# EAGLE design ExpansionModule (EAGLE 9.6.2)
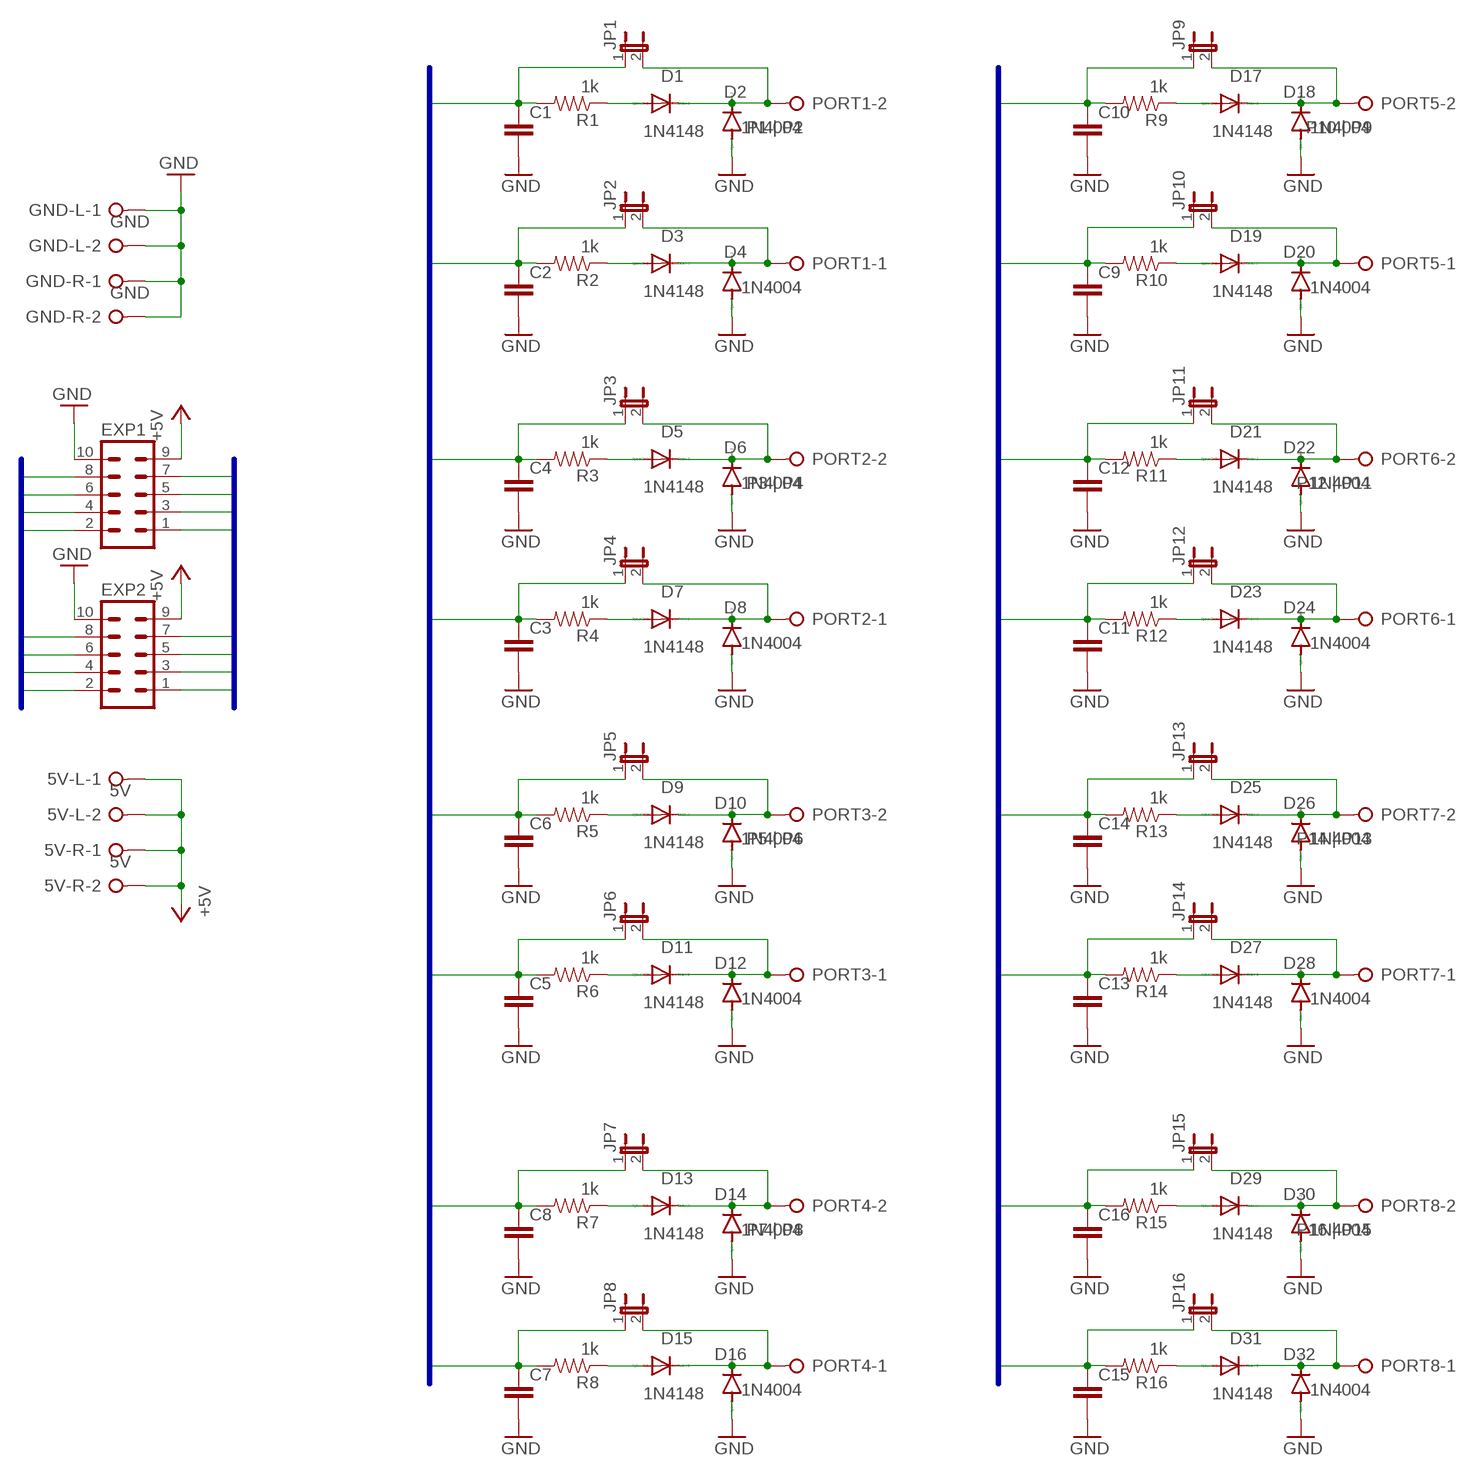
[diagram p0: schematic, sheet 1]

## Parts
5V-L  5V  W237-02P  [W237-132]
5V-R  5V  W237-02P  [W237-132]
C1  C-EU050-030X075  [C050-030X075]
C2  C-EU050-030X075  [C050-030X075]
C3  C-EU050-030X075  [C050-030X075]
C4  C-EU050-030X075  [C050-030X075]
C5  C-EU050-030X075  [C050-030X075]
C6  C-EU050-030X075  [C050-030X075]
C7  C-EU050-030X075  [C050-030X075]
C8  C-EU050-030X075  [C050-030X075]
C9  C-EU050-030X075  [C050-030X075]
C10  C-EU050-030X075  [C050-030X075]
C11  C-EU050-030X075  [C050-030X075]
C12  C-EU050-030X075  [C050-030X075]
C13  C-EU050-030X075  [C050-030X075]
C14  C-EU050-030X075  [C050-030X075]
C15  C-EU050-030X075  [C050-030X075]
C16  C-EU050-030X075  [C050-030X075]
D1  1N4148  1N4148DO35-7  [DO35-7]
D2  1N4004  [DO41-10]
D3  1N4148  1N4148DO35-7  [DO35-7]
D4  1N4004  [DO41-10]
D5  1N4148  1N4148DO35-7  [DO35-7]
D6  1N4004  [DO41-10]
D7  1N4148  1N4148DO35-7  [DO35-7]
D8  1N4004  [DO41-10]
D9  1N4148  1N4148DO35-7  [DO35-7]
D10  1N4004  [DO41-10]
D11  1N4148  1N4148DO35-7  [DO35-7]
D12  1N4004  [DO41-10]
D13  1N4148  1N4148DO35-7  [DO35-7]
D14  1N4004  [DO41-10]
D15  1N4148  1N4148DO35-7  [DO35-7]
D16  1N4004  [DO41-10]
D17  1N4148  1N4148DO35-7  [DO35-7]
D18  1N4004  [DO41-10]
D19  1N4148  1N4148DO35-7  [DO35-7]
D20  1N4004  [DO41-10]
D21  1N4148  1N4148DO35-7  [DO35-7]
D22  1N4004  [DO41-10]
D23  1N4148  1N4148DO35-7  [DO35-7]
D24  1N4004  [DO41-10]
D25  1N4148  1N4148DO35-7  [DO35-7]
D26  1N4004  [DO41-10]
D27  1N4148  1N4148DO35-7  [DO35-7]
D28  1N4004  [DO41-10]
D29  1N4148  1N4148DO35-7  [DO35-7]
D30  1N4004  [DO41-10]
D31  1N4148  1N4148DO35-7  [DO35-7]
D32  1N4004  [DO41-10]
EXP1  ML10  [ML10]
EXP2  ML10  [ML10]
GND-L  GND  W237-02P  [W237-132]
GND-R  GND  W237-02P  [W237-132]
JP1  JP1E  [JP1]
JP2  JP1E  [JP1]
JP3  JP1E  [JP1]
JP4  JP1E  [JP1]
JP5  JP1E  [JP1]
JP6  JP1E  [JP1]
JP7  JP1E  [JP1]
JP8  JP1E  [JP1]
JP9  JP1E  [JP1]
JP10  JP1E  [JP1]
JP11  JP1E  [JP1]
JP12  JP1E  [JP1]
JP13  JP1E  [JP1]
JP14  JP1E  [JP1]
JP15  JP1E  [JP1]
JP16  JP1E  [JP1]
PORT1  P1 | P2  W237-02P  [W237-132]
PORT2  P3 | P4  W237-02P  [W237-132]
PORT3  P5 | P6  W237-02P  [W237-132]
PORT4  P7 | P8  W237-02P  [W237-132]
PORT5  P10 | P9  W237-02P  [W237-132]
PORT6  P12 | P11  W237-02P  [W237-132]
PORT7  P14 | P13  W237-02P  [W237-132]
PORT8  P16 | P15  W237-02P  [W237-132]
R1  1k  RESISTORAXIAL-0.3  [AXIAL-0.3]
R2  1k  RESISTORAXIAL-0.3  [AXIAL-0.3]
R3  1k  RESISTORAXIAL-0.3  [AXIAL-0.3]
R4  1k  RESISTORAXIAL-0.3  [AXIAL-0.3]
R5  1k  RESISTORAXIAL-0.3  [AXIAL-0.3]
R6  1k  RESISTORAXIAL-0.3  [AXIAL-0.3]
R7  1k  RESISTORAXIAL-0.3  [AXIAL-0.3]
R8  1k  RESISTORAXIAL-0.3  [AXIAL-0.3]
R9  1k  RESISTORAXIAL-0.3  [AXIAL-0.3]
R10  1k  RESISTORAXIAL-0.3  [AXIAL-0.3]
R11  1k  RESISTORAXIAL-0.3  [AXIAL-0.3]
R12  1k  RESISTORAXIAL-0.3  [AXIAL-0.3]
R13  1k  RESISTORAXIAL-0.3  [AXIAL-0.3]
R14  1k  RESISTORAXIAL-0.3  [AXIAL-0.3]
R15  1k  RESISTORAXIAL-0.3  [AXIAL-0.3]
R16  1k  RESISTORAXIAL-0.3  [AXIAL-0.3]

## Nets
+5V: 5V-L.1 5V-L.2 5V-R.1 5V-R.2 EXP1.9 EXP2.9
A0: C12.1 EXP2.3 JP11.1 R11.P$2
A1: C11.1 EXP2.4 JP12.1 R12.P$2
A2: C14.1 EXP2.5 JP13.1 R13.P$2
A3: C13.1 EXP2.6 JP14.1 R14.P$2
GND [ground]: C1.2 C2.2 C3.2 C4.2 C5.2 C6.2 C7.2 C8.2 C9.2 C10.2 C11.2 C12.2 C13.2 C14.2 C15.2 C16.2 D2.A D4.A D6.A D8.A D10.A D12.A D14.A D16.A D18.A D20.A D22.A D24.A D26.A D28.A D30.A D32.A EXP1.10 EXP2.10 GND-L.1 GND-L.2 GND-R.1 GND-R.2
N$2: D1.A R1.P$1
N$3: D3.A R2.P$1
N$6: D5.A R3.P$1
N$7: D7.A R4.P$1
N$10: D9.A R5.P$1
N$11: D11.A R6.P$1
N$14: D13.A R7.P$1
N$15: D15.A R8.P$1
N$18: D17.A R9.P$1
N$19: D19.A R10.P$1
N$22: D21.A R11.P$1
N$23: D23.A R12.P$1
N$26: D25.A R13.P$1
N$27: D27.A R14.P$1
N$30: D29.A R15.P$1
N$31: D31.A R16.P$1
PIN2: C1.1 EXP1.1 JP1.1 R1.P$2
PIN3: C2.1 EXP1.2 JP2.1 R2.P$2
PIN4: C4.1 EXP1.3 JP3.1 R3.P$2
PIN5: C3.1 EXP1.4 JP4.1 R4.P$2
PIN6: C6.1 EXP1.5 JP5.1 R5.P$2
PIN9: C5.1 EXP1.6 JP6.1 R6.P$2
PIN10: C8.1 EXP1.7 JP7.1 R7.P$2
PIN11: C7.1 EXP1.8 JP8.1 R8.P$2
PIN12: C10.1 EXP2.1 JP9.1 R9.P$2
PIN13: C9.1 EXP2.2 JP10.1 R10.P$2
PORT1: D1.C D2.C JP1.2 PORT1.2
PORT2: D3.C D4.C JP2.2 PORT1.1
PORT3: D5.C D6.C JP3.2 PORT2.2
PORT4: D7.C D8.C JP4.2 PORT2.1
PORT5: D9.C D10.C JP5.2 PORT3.2
PORT6: D11.C D12.C JP6.2 PORT3.1
PORT7: D13.C D14.C JP7.2 PORT4.2
PORT8: D15.C D16.C JP8.2 PORT4.1
PORT9: D17.C D18.C JP9.2 PORT5.2
PORT10: D19.C D20.C JP10.2 PORT5.1
PORT11: D21.C D22.C JP11.2 PORT6.2
PORT12: D23.C D24.C JP12.2 PORT6.1
PORT13: D25.C D26.C JP13.2 PORT7.2
PORT14: D27.C D28.C JP14.2 PORT7.1
PORT15: D29.C D30.C JP15.2 PORT8.2
PORT16: D31.C D32.C JP16.2 PORT8.1
SCL: C15.1 EXP2.8 JP16.1 R16.P$2
SDA: C16.1 EXP2.7 JP15.1 R15.P$2

## Buses
EXPANSION:A0,A1,A2,A3,PIN2,PIN3,PIN4,PIN5,PIN6,PIN9,PIN10,PIN11,PIN12,PIN13,SCL,SDA

## Library data of the parts
5V-L 5V-R GND-L GND-R PORT1-PORT8 = con-wago-508:W237-02P: WAGO SREW CLAMP; OC_FARNELL: unknown; OC_NEWARK: unknown
C1-C16 = rcl:C-EU: CAPACITOR, European symbol; SPICEPREFIX: C
D1 D3 D5 D7 D9 D11 D13 D15 D17 D19 D21 D23 D25 D27 D29 D31 = diode:1N4148: DIODE high speed (Philips)
D2 D4 D6 D8 D10 D12 D14 D16 D18 D20 D22 D24 D26 D28 D30 D32 = diode:1N4004: DIODE general purpose rectifier, 1 A
EXP1 EXP2 = con-ml:ML10: HARTING; OC_FARNELL: unknown; OC_NEWARK: unknown
JP1-JP16 = jumper:JP1E: JUMPER
R1-R16 = SparkFun-Resistors:RESISTOR: Resistor Basic schematic elements and footprints for 0603, 1206, and PTH resistors.

## Net classes
0 default: width 0.254 mm
1 ground: width 0.61 mm
2 5v: width 0.508 mm

## Board
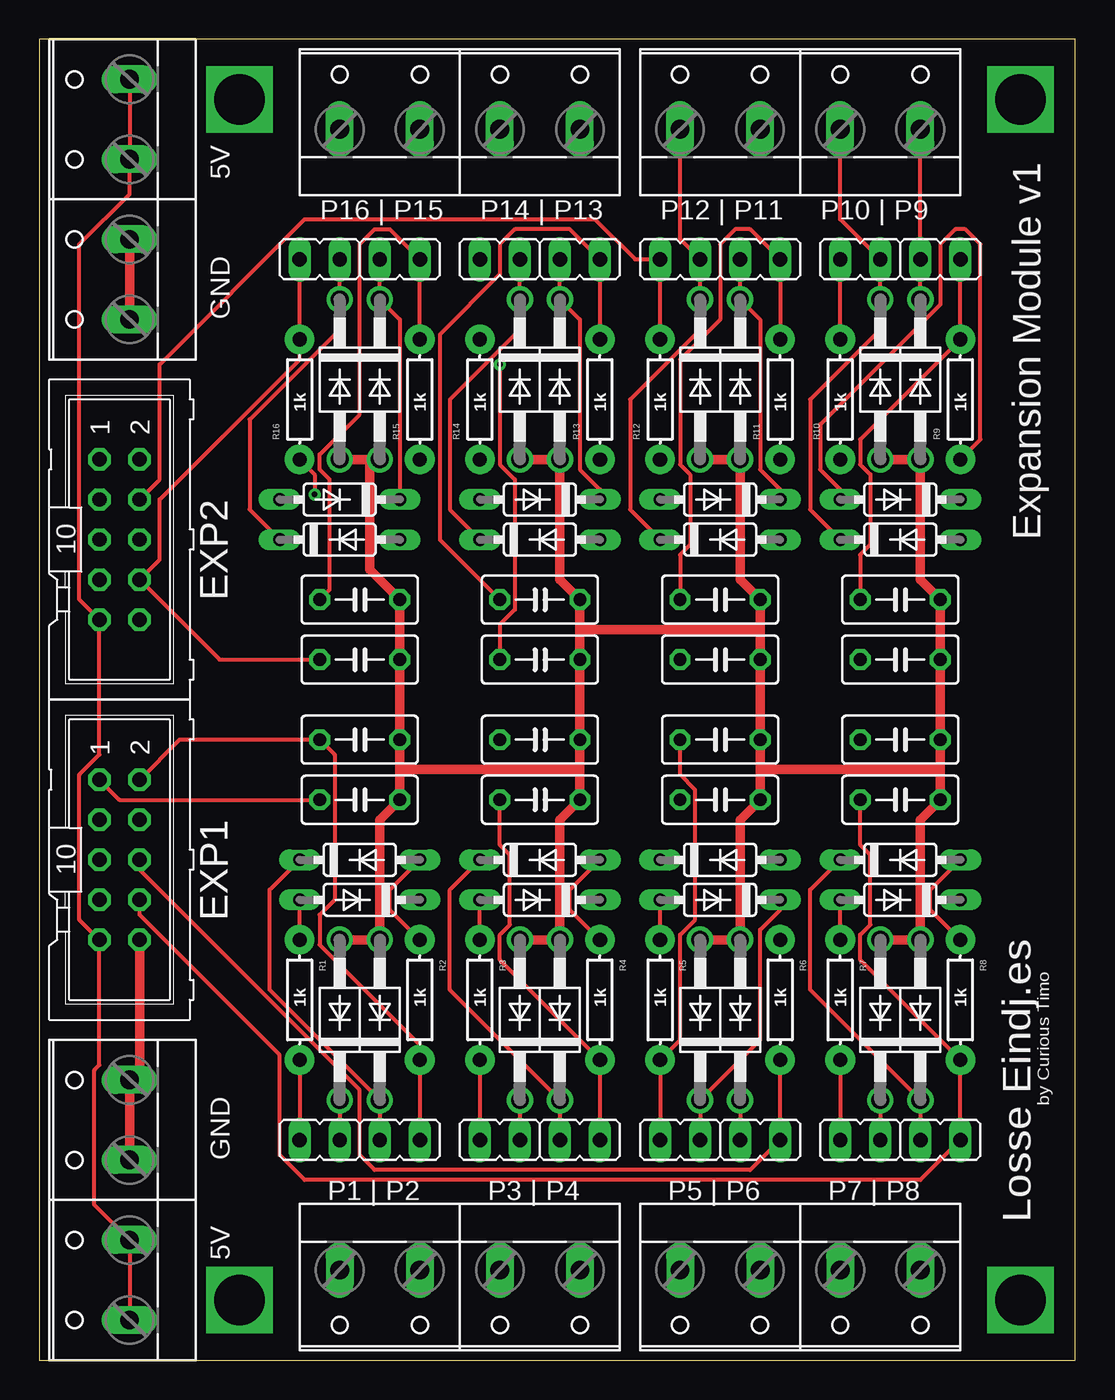
[diagram p1: board, top side]
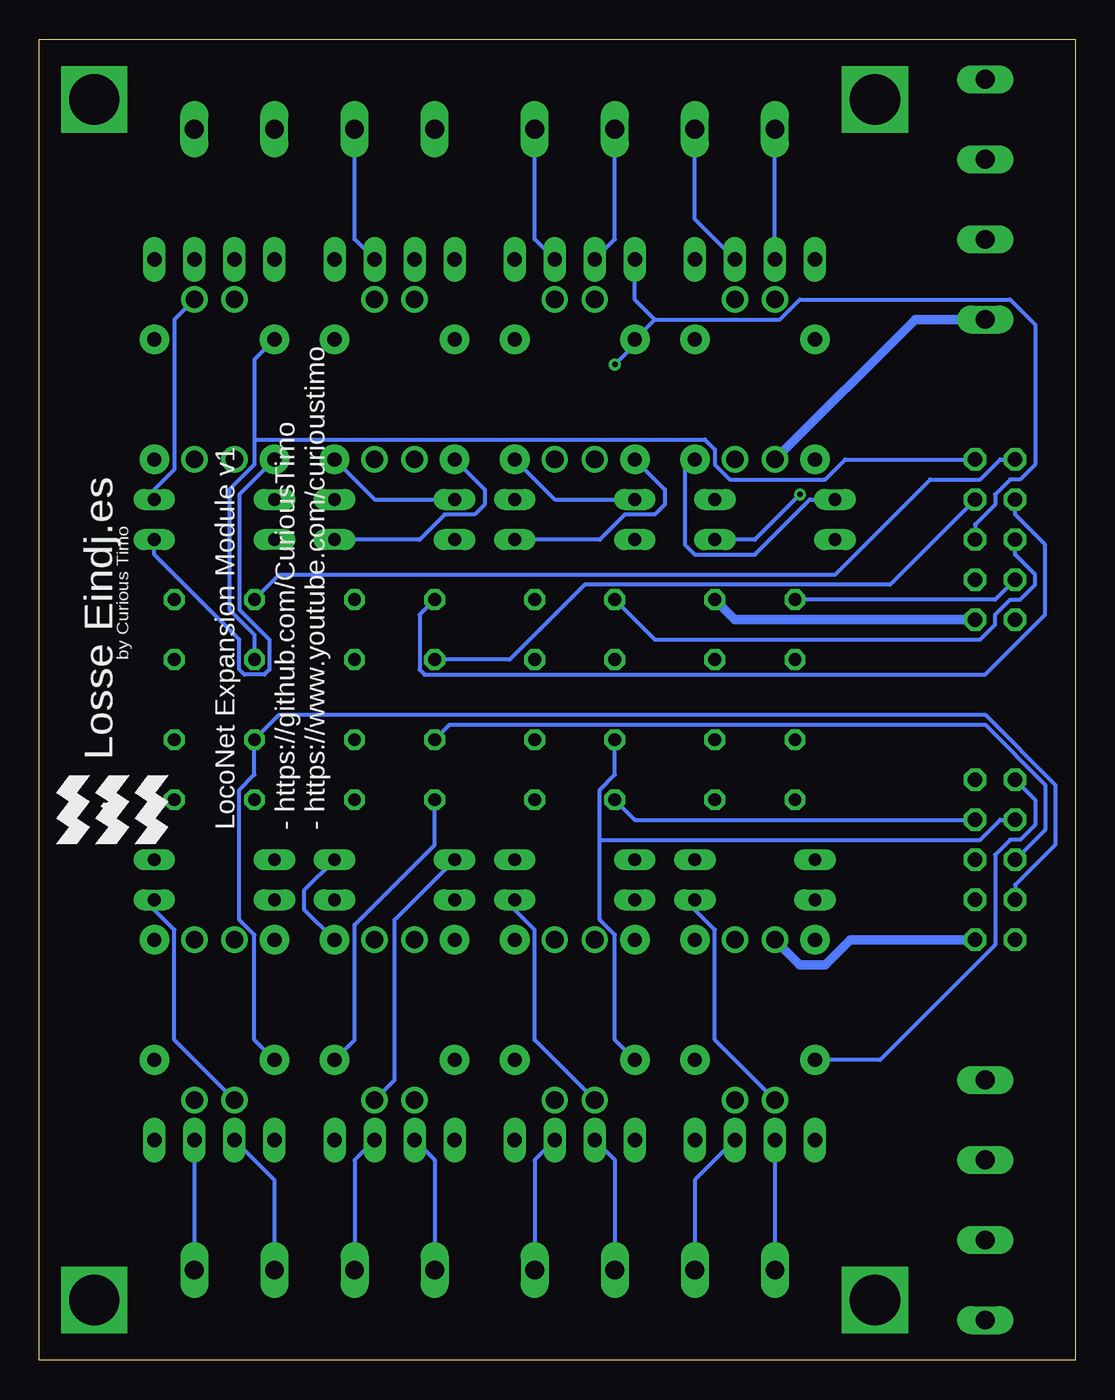
[diagram p2: board, bottom side, seen from below]

Size 65.71 x 83.81 mm. Coordinates in mm from the lower left corner, seen from the top.
Outline: 0,0 65.71,0 65.71,83.81 0,83.81 0,0
Copper layers (1*16): Top 0.035mm / dielectric 1.5mm / Bottom 0.035mm
Design rules "default": minimum track width 6mil, minimum drill 0.35mm, track to track 6mil, track to pad 6mil, pad to pad 6mil, via to via 6mil, smd to smd 6mil, copper to edge 40mil, drill to drill 6mil, minimum pad ring 10mil, minimum via ring 8mil, stop-mask expansion 4mil, vias tented up to drill 0mil, thermal gap 10mil

### Footprints (pad centres in the part's own frame; a part is rotated, then mirrored left to right if it is on the bottom)
W237-132 = drill 1.194 long: 1 -2.54,-0.635; 2 2.54,-0.635
C050-030X075 = drill 0.813 octagon: 1 -2.54,0; 2 2.54,0
DO35-7 = drill 0.813 long: A 3.81,0; C -3.81,0
DO41-10 = drill 1.118: A 5.08,0; C -5.08,0
ML10 = drill 0.914 octagon: 1 -5.08,-1.27; 2 -5.08,1.27; 3 -2.54,-1.27; 4 -2.54,1.27; 5 0,-1.27; 6 0,1.27; 7 2.54,-1.27; 8 2.54,1.27; 9 5.08,-1.27; 10 5.08,1.27
JP1 = drill 0.914 long: 1 0,-1.27; 2 0,1.27
AXIAL-0.3 = drill 0.9 pad 1.88: P$1 -3.81,0; P$2 3.81,0

### Placement (x,y rotation side)
5V-L  5.08,78.74 90 top
5V-R  5.08,5.08 90 top
C1  20.32,35.56 0 top
C2  20.32,39.37 0 top
C3  31.75,35.56 0 top
C4  31.75,39.37 0 top
C5  43.18,35.56 0 top
C6  43.18,39.37 0 top
C7  54.61,35.56 0 top
C8  54.61,39.37 0 top
C9  54.61,44.45 0 top
C10  54.61,48.26 0 top
C11  43.18,44.45 0 top
C12  43.18,48.26 0 top
C13  31.75,44.45 0 top
C14  31.75,48.26 0 top
C15  20.32,44.45 0 top
C16  20.32,48.26 0 top
D1  20.32,29.21 180 top
D2  19.05,21.59 90 top
D3  20.32,31.75 0 top
D4  21.59,21.59 90 top
D5  31.75,29.21 180 top
D6  30.48,21.59 90 top
D7  31.75,31.75 0 top
D8  33.02,21.59 90 top
D9  43.18,29.21 180 top
D10  41.91,21.59 90 top
D11  43.18,31.75 0 top
D12  44.45,21.59 90 top
D13  54.61,29.21 180 top
D14  53.34,21.59 90 top
D15  54.61,31.75 0 top
D16  55.88,21.59 90 top
D17  54.61,54.61 180 top
D18  55.88,62.23 270 top
D19  54.61,52.07 0 top
D20  53.34,62.23 270 top
D21  43.18,54.61 180 top
D22  44.45,62.23 270 top
D23  43.18,52.07 0 top
D24  41.91,62.23 270 top
D25  31.75,54.61 180 top
D26  33.02,62.23 270 top
D27  31.75,52.07 0 top
D28  30.48,62.23 270 top
D29  19.05,54.61 180 top
D30  21.59,62.23 270 top
D31  19.05,52.07 0 top
D32  19.05,62.23 270 top
EXP1  5.08,31.75 270 top
EXP2  5.08,52.07 270 top
GND-L  5.08,68.58 90 top
GND-R  5.08,15.24 90 top
JP1  17.78,13.97 270 top
JP2  22.86,13.97 90 top
JP3  29.21,13.97 270 top
JP4  34.29,13.97 90 top
JP5  40.64,13.97 270 top
JP6  45.72,13.97 90 top
JP7  52.07,13.97 270 top
JP8  57.15,13.97 90 top
JP9  57.15,69.85 90 top
JP10  52.07,69.85 270 top
JP11  45.72,69.85 90 top
JP12  40.64,69.85 270 top
JP13  34.29,69.85 90 top
JP14  29.21,69.85 270 top
JP15  22.86,69.85 90 top
JP16  17.78,69.85 270 top
PORT1  21.59,5.08 180 top
PORT2  31.75,5.08 180 top
PORT3  43.18,5.08 180 top
PORT4  53.34,5.08 180 top
PORT5  53.34,78.74 0 top
PORT6  43.18,78.74 0 top
PORT7  31.75,78.74 0 top
PORT8  21.59,78.74 0 top
R1  16.51,22.86 270 top
R2  24.13,22.86 270 top
R3  27.94,22.86 270 top
R4  35.56,22.86 270 top
R5  39.37,22.86 270 top
R6  46.99,22.86 270 top
R7  50.8,22.86 270 top
R8  58.42,22.86 270 top
R9  58.42,60.96 90 top
R10  50.8,60.96 90 top
R11  46.99,60.96 90 top
R12  39.37,60.96 90 top
R13  35.56,60.96 90 top
R14  27.94,60.96 90 top
R15  24.13,60.96 90 top
R16  16.51,60.96 90 top

### Tracks (layer width: path | path; a pad name or v marks a point on that pad's centre or on a via)
+5V
  Top 0.254: 5V-L.2 5V-L.1 5.71,73.98 2.54,70.8 2.54,48.26 EXP2.9 3.81,38.42 2.54,37.15 2.54,27.94 EXP1.9 3.81,18.73 3.49,18.41 3.49,9.84 5V-R.2 5V-R.1
A0
  Top 0.254: C12.1 40.64,51.12 41.28,51.75 41.28,56.2 40.64,56.83 40.64,63.5 43.18,66.04 43.18,70.8 44.13,71.76 45.09,71.76 JP11.1 R11.P$2
  Bottom 0.254: EXP2.3 3.81,53.66 1.91,51.75 1.91,47.31 5.71,43.5 41.28,43.5 41.59,43.81 41.59,47.31 C12.1
A1
  Top 0.254: R12.P$2 JP12.1 37.78,69.85 35.24,72.39 16.83,72.39 7.62,63.18 7.62,55.88 EXP2.4
  Bottom 0.254: C11.1 35.88,44.45 31.11,49.21 11.75,49.21 EXP2.4
A2
  Top 0.254: C14.1 25.4,52.07 25.4,65.09 29.21,68.9 29.21,70.8 30.16,71.76 33.66,71.76 JP13.1 R13.P$2
  Bottom 0.254: EXP2.5 3.81,51.12 2.54,49.85 2.54,49.21 3.49,48.26 4.13,48.26 5.08,47.31 5.08,46.67 6.03,45.72 26.67,45.72 C14.1
A3  (via drill 0.35)
  Top 0.254: C13.1 29.21,46.67 30.16,47.62 30.16,55.88 29.21,56.83 v29.21,63.18
  Bottom 0.254: v29.21,63.18 27.94,64.45 R14.P$2 26.67,66.04 | EXP2.6 6.35,53.02 5.08,54.29 5.08,54.93 4.13,55.88 3.49,55.88 2.54,56.83 2.54,65.72 4.13,67.31 17.46,67.31 18.73,66.04 26.67,66.04 | JP14.1 27.94,67.31 26.67,66.04
GND
  Top 0.61: D24.A D22.A 44.45,49.53 C12.2 45.72,46.35 | D10.A D12.A 44.45,34.29 C5.2 45.72,37.46 | 45.72,37.46 C6.2 C11.2 45.72,46.35 | D20.A D18.A 55.88,49.53 C10.2 C9.2 C8.2 57.15,37.46 | D14.A D16.A 55.88,34.29 C7.2 57.15,37.46 | 57.15,37.46 45.72,37.46 | D28.A D26.A 33.02,49.53 C14.2 34.29,46.35 | D6.A D8.A 33.02,34.29 C3.2 34.29,37.46 | 34.29,37.46 C4.2 C13.2 34.29,46.35 | EXP1.10 6.35,18.41 GND-R.2 GND-R.1 | GND-L.2 GND-L.1 | 20.95,57.15 D32.A | D2.A D4.A 21.59,34.29 C1.2 22.86,37.46 | 22.86,37.46 C2.2 C15.2 C16.2 20.95,50.16 20.95,57.15 | 20.95,57.15 D30.A | 22.86,37.46 34.29,37.46 | 34.29,46.35 45.72,46.35
  Bottom 0.61: EXP2.10 21.59,46.99 C16.2 | GND-L.1 10.16,66.04 D32.A | EXP1.10 14.29,26.67 15.88,25.08 17.46,25.08 D2.A
N$2
  Top 0.254: R1.P$1 D1.A
N$3
  Top 0.254: D3.A 22.22,29.84 22.22,28.57 R2.P$1
N$6
  Top 0.254: R3.P$1 D5.A
N$7
  Top 0.254: D7.A 33.66,29.84 33.66,28.57 R4.P$1
N$10
  Top 0.254: R5.P$1 D9.A
N$11
  Bottom 0.254: D11.A 48.9,29.84 48.9,28.57 R6.P$1
N$14
  Top 0.254: R7.P$1 D13.A
N$15
  Top 0.254: D15.A 56.52,29.84 56.52,28.57 R8.P$1
N$18
  Top 0.254: D17.A 50.8,55.24 49.53,56.52 49.53,59.37 57.15,66.99 57.15,70.8 58.1,71.76 58.74,71.76 59.69,70.8 59.69,58.42 R9.P$1
N$19
  Bottom 0.254: D19.A 58.42,51.12 53.02,45.72 53.02,43.81 52.71,43.5 51.44,43.5 51.12,43.81 51.12,45.72 53.02,47.62 53.02,54.93 R10.P$1
N$22
  Bottom 0.254: D21.A 44.45,54.61 R11.P$1
N$23
  Bottom 0.254: D23.A 41.59,52.07 40.01,53.66 38.1,53.66 37.47,54.29 37.47,55.24 R12.P$1
N$26
  Bottom 0.254: D25.A 33.02,54.61 R13.P$1
N$27
  Bottom 0.254: D27.A 30.16,52.07 28.57,53.66 26.67,53.66 26.04,54.29 26.04,55.24 R14.P$1
N$30
  Bottom 0.254: D29.A 16.83,54.61 20.32,51.12 24.13,51.12 24.76,51.75 24.76,56.52 R15.P$1
N$31  (via drill 0.35)
  Top 0.254: v17.46,54.93 17.46,56.2 R16.P$1
  Bottom 0.254: D31.A 20.32,52.07 v17.46,54.93
N$33  (via drill 3.2 pad 3.81)
  other vias: 12.7,80.01
N$34  (via drill 3.2 pad 3.81)
  other vias: 12.7,3.81
N$35  (via drill 3.2 pad 3.81)
  other vias: 62.23,80.01
N$36  (via drill 3.2 pad 3.81)
  other vias: 62.23,3.81
PIN2
  Top 0.254: R1.P$2 JP1.1 | C1.1 5.08,35.56 EXP1.1
  Bottom 0.254: R1.P$2 12.38,19.05 5.08,26.35 5.08,32.07 4.13,33.02 3.49,33.02 2.54,33.97 2.54,35.56 EXP1.1
PIN3
  Top 0.254: JP2.1 R2.P$2 24.13,20 17.78,26.35 17.78,28.26 18.73,29.21 18.73,38.42 C2.1 8.89,39.37 EXP1.2
PIN4
  Top 0.254: R3.P$2 JP3.1
  Bottom 0.254: C4.1 29.21,37.15 30.16,36.2 30.16,33.02 | 30.16,33.02 30.16,27.94 29.21,26.99 29.21,20.32 R3.P$2 | EXP1.3 4.76,34.29 6.03,33.02 30.16,33.02
PIN5
  Top 0.254: C3.1 29.21,32.7 29.84,32.07 29.84,27.62 29.21,26.99 29.21,25.4 R4.P$2 JP4.1
  Bottom 0.254: EXP1.4 27.94,34.29 C3.1
PIN6
  Top 0.254: C6.1 40.64,37.15 41.59,36.2 41.59,27.94 40.64,26.99 40.64,20.32 R5.P$2 JP5.1
  Bottom 0.254: EXP1.5 1.91,33.66 1.91,36.51 5.71,40.32 39.69,40.32 C6.1
PIN9
  Top 0.254: EXP1.6 6.35,31.11 20.32,17.14 20.32,13.02 21.27,12.07 45.09,12.07 JP6.1 R6.P$2
  Bottom 0.254: C5.1 40.64,32.7 45.72,27.62 45.72,20.32 R6.P$2
PIN10
  Top 0.254: R7.P$2 JP7.1
  Bottom 0.254: R7.P$2 52.07,20.32 52.07,26.99 53.02,27.94 53.02,36.2 52.07,37.15 C8.1 50.48,40.96 5.71,40.96 1.27,36.51 1.27,32.7 3.81,30.16 EXP1.7
PIN11
  Top 0.254: C7.1 52.07,32.7 52.71,32.07 52.71,27.62 52.07,26.99 52.07,25.4 R8.P$2 JP8.1 55.88,11.43 16.83,11.43 15.24,13.02 15.24,19.37 6.35,28.26 EXP1.8
PIN12
  Top 0.254: C10.1 52.07,51.12 52.71,51.75 52.71,56.2 52.07,56.83 52.07,58.42 R9.P$2 JP9.1
  Bottom 0.254: EXP2.1 4.76,57.15 6.03,55.88 9.21,55.88 15.24,49.85 50.48,49.85 C10.1
PIN13
  Top 0.254: R10.P$2 JP10.1
  Bottom 0.254: C9.1 52.07,46.04 53.66,47.62 53.66,55.24 52.07,56.83 52.07,58.42 | 52.07,58.42 52.07,63.5 R10.P$2 | EXP2.2 14.61,57.15 15.88,55.88 21.91,55.88 22.86,56.83 22.86,57.78 23.49,58.42 52.07,58.42
PORT1
  Top 0.254: D2.C JP1.2
  Bottom 0.254: D1.C 24.13,28.57 22.86,27.3 22.86,20.32 D2.C | JP1.2 PORT1.2
PORT2
  Top 0.254: D3.C 14.61,29.84 14.61,23.49 D4.C JP2.2
  Bottom 0.254: PORT1.1 24.13,11.43 JP2.2
PORT3
  Top 0.254: D6.C JP3.2
  Bottom 0.254: D5.C 35.56,28.57 34.29,27.3 34.29,20.32 D6.C | PORT2.2 29.21,12.7 JP3.2
PORT4
  Top 0.254: D7.C 26.04,29.84 26.04,23.49 D8.C JP4.2
  Bottom 0.254: PORT2.1 34.29,12.7 JP4.2
PORT5
  Top 0.254: D9.C 46.99,28.57 45.72,27.3 45.72,20.32 D10.C JP5.2
  Bottom 0.254: PORT3.2 40.64,12.7 JP5.2
PORT6
  Top 0.254: D12.C JP6.2
  Bottom 0.254: D11.C 43.18,27.94 43.18,17.78 D12.C | PORT3.1 45.72,12.7 JP6.2
PORT7
  Top 0.254: D14.C JP7.2
  Bottom 0.254: D13.C 58.42,28.57 57.15,27.3 57.15,20.32 D14.C | PORT4.2 50.8,11.43 JP7.2
PORT8
  Top 0.254: D15.C 48.9,29.84 48.9,23.49 D16.C JP8.2
  Bottom 0.254: JP8.2 PORT4.1
PORT9
  Top 0.254: D18.C JP9.2 PORT5.2
  Bottom 0.254: D17.C 58.42,55.24 57.15,56.52 57.15,66.04 D18.C
PORT10
  Top 0.254: D19.C 48.9,53.98 48.9,60.96 53.34,65.41 D20.C JP10.2 50.8,72.39 PORT5.1
PORT11
  Top 0.254: D21.C 46.99,55.24 45.72,56.52 45.72,66.04 D22.C JP11.2
  Bottom 0.254: PORT6.2 45.72,71.12 JP11.2
PORT12
  Top 0.254: D23.C 37.47,53.98 37.47,60.96 41.91,65.41 D24.C JP12.2 40.64,71.12 PORT6.1
PORT13
  Top 0.254: D25.C 35.56,55.24 34.29,56.52 34.29,66.04 D26.C JP13.2
  Bottom 0.254: PORT7.2 34.29,71.12 JP13.2
PORT14
  Top 0.254: D27.C 26.04,53.98 26.04,60.96 30.48,65.41 D28.C JP14.2
  Bottom 0.254: PORT7.1 29.21,71.12 JP14.2
PORT15
  Top 0.254: D29.C 22.86,66.04 D30.C JP15.2
  Bottom 0.254: PORT8.2 24.13,72.39 JP15.2
PORT16
  Top 0.254: D31.C 13.34,53.98 13.34,59.69 19.05,65.41 D32.C JP16.2
  Bottom 0.254: JP16.2 PORT8.1
SCL
  Top 0.254: JP16.1 R16.P$2 16.51,63.5 7.62,54.61 7.62,50.8 EXP2.8 11.43,44.45 C15.1
SDA
  Top 0.254: R15.P$2 JP15.1 22.22,71.76 21.27,71.76 20.32,70.8 20.32,60.01 17.78,57.47 17.78,56.52 18.41,55.88 18.41,48.89 C16.1
  Bottom 0.254: C16.1 5.08,48.26 EXP2.7

### Text on the board
tPlace: Expansion Module v1 | by Curious Timo
bPlace: by Curious Timo | Losse Eindj.es | LocoNet Expansion Module v1 / / - https://github.com/CuriousTimo / - https://www.youtube.com/curioustimo
tNames: Losse Eindj.es